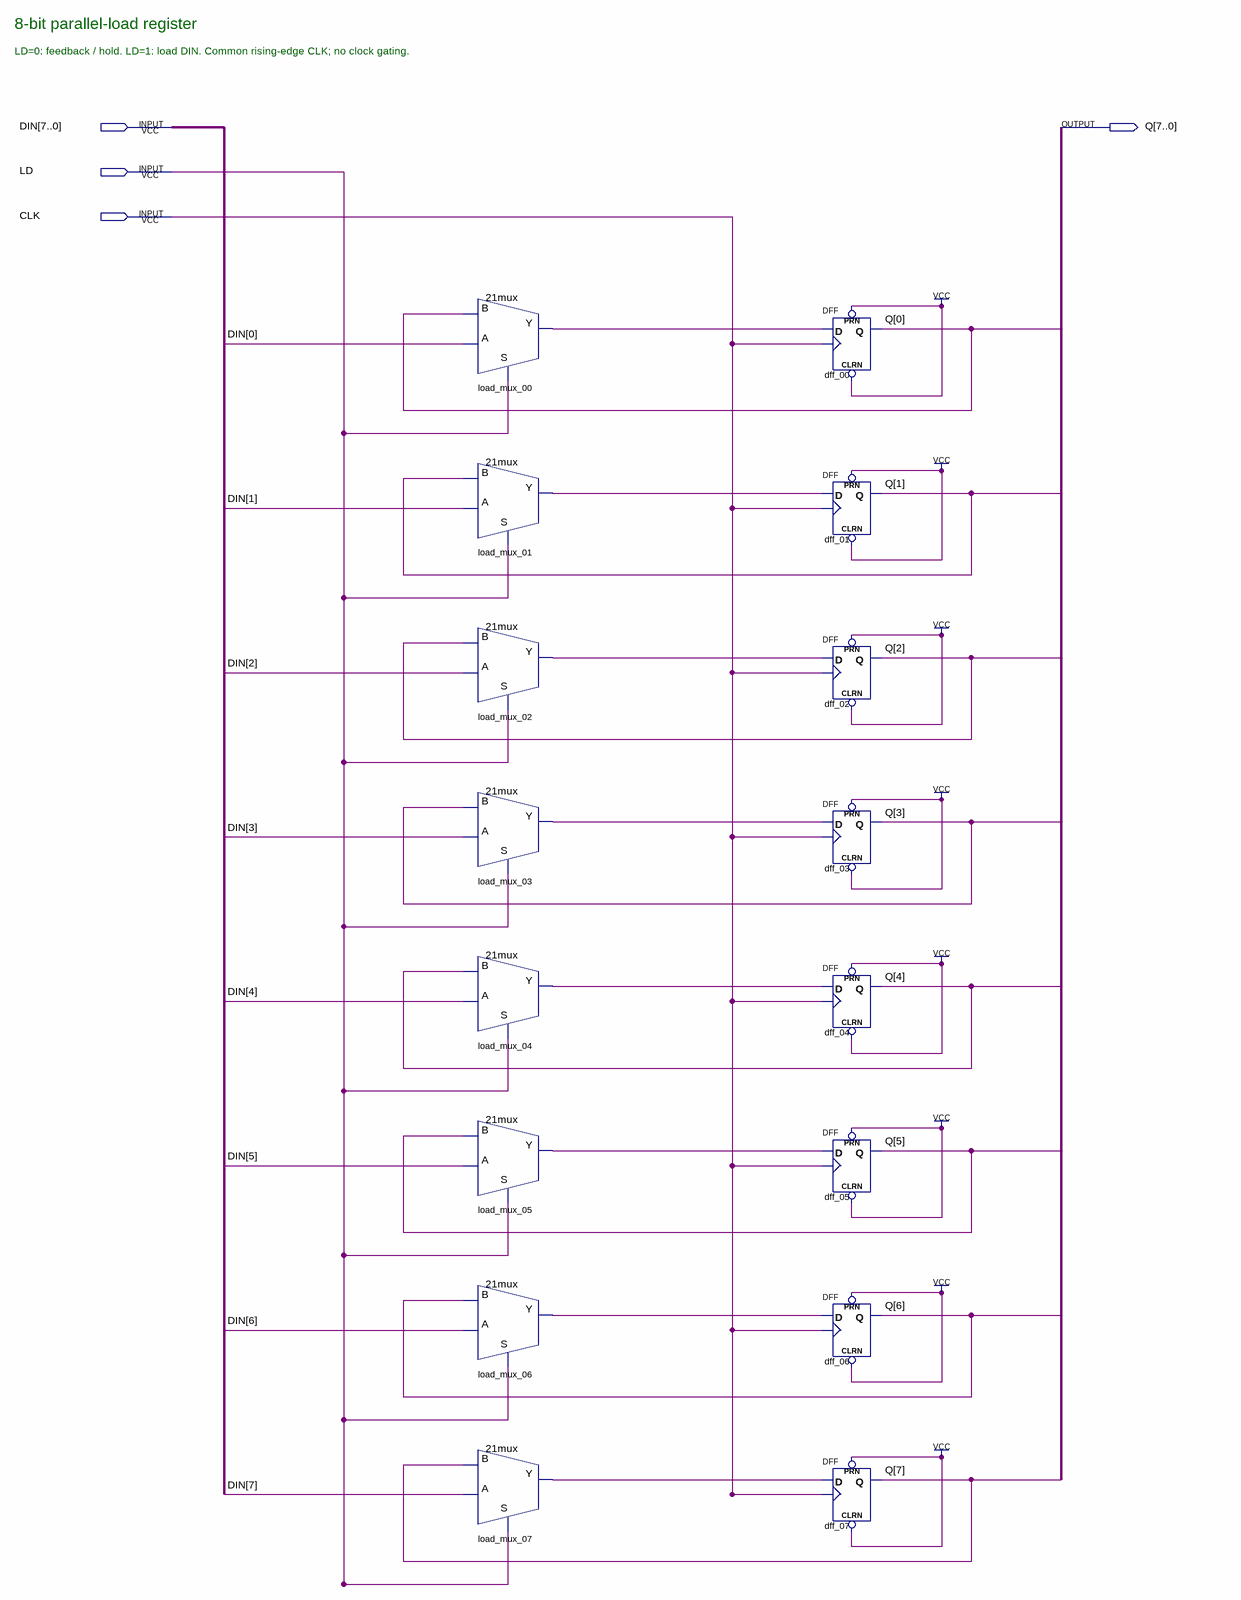
[diagram p0: schematic sheet]
// Quartus schematic register8.bdf as structural Verilog: 16 symbols, 4 pins
module register8 (
  input  [7:0] DIN,
  input  LD,
  input  CLK,
  output [7:0] Q
);

  wire NEXT_0, NEXT_1, NEXT_2, NEXT_3, NEXT_4, NEXT_5, NEXT_6, NEXT_7;

  \21mux  load_mux_00 (.B(Q[0]), .A(DIN[0]), .S(LD), .Y(NEXT_0));
  \21mux  load_mux_01 (.B(Q[1]), .A(DIN[1]), .S(LD), .Y(NEXT_1));
  \21mux  load_mux_02 (.B(Q[2]), .A(DIN[2]), .S(LD), .Y(NEXT_2));
  \21mux  load_mux_03 (.B(Q[3]), .A(DIN[3]), .S(LD), .Y(NEXT_3));
  \21mux  load_mux_04 (.B(Q[4]), .A(DIN[4]), .S(LD), .Y(NEXT_4));
  \21mux  load_mux_05 (.B(Q[5]), .A(DIN[5]), .S(LD), .Y(NEXT_5));
  \21mux  load_mux_06 (.B(Q[6]), .A(DIN[6]), .S(LD), .Y(NEXT_6));
  \21mux  load_mux_07 (.B(Q[7]), .A(DIN[7]), .S(LD), .Y(NEXT_7));
  DFF dff_00 (.CLRN(1'b1), .CLK(CLK), .D(NEXT_0), .PRN(1'b1), .Q(Q[0]));
  DFF dff_01 (.CLRN(1'b1), .CLK(CLK), .D(NEXT_1), .PRN(1'b1), .Q(Q[1]));
  DFF dff_02 (.CLRN(1'b1), .CLK(CLK), .D(NEXT_2), .PRN(1'b1), .Q(Q[2]));
  DFF dff_03 (.CLRN(1'b1), .CLK(CLK), .D(NEXT_3), .PRN(1'b1), .Q(Q[3]));
  DFF dff_04 (.CLRN(1'b1), .CLK(CLK), .D(NEXT_4), .PRN(1'b1), .Q(Q[4]));
  DFF dff_05 (.CLRN(1'b1), .CLK(CLK), .D(NEXT_5), .PRN(1'b1), .Q(Q[5]));
  DFF dff_06 (.CLRN(1'b1), .CLK(CLK), .D(NEXT_6), .PRN(1'b1), .Q(Q[6]));
  DFF dff_07 (.CLRN(1'b1), .CLK(CLK), .D(NEXT_7), .PRN(1'b1), .Q(Q[7]));

  // Notes on the sheet:
  //   8-bit parallel-load register
  //   LD=0: feedback / hold. LD=1: load DIN. Common rising-edge CLK; no clock gating.
endmodule
